# Altium schematic sheet S10_Adc.SchDoc
size 420 x 297 mm; SheetNumber: 10; SheetTotal: 12
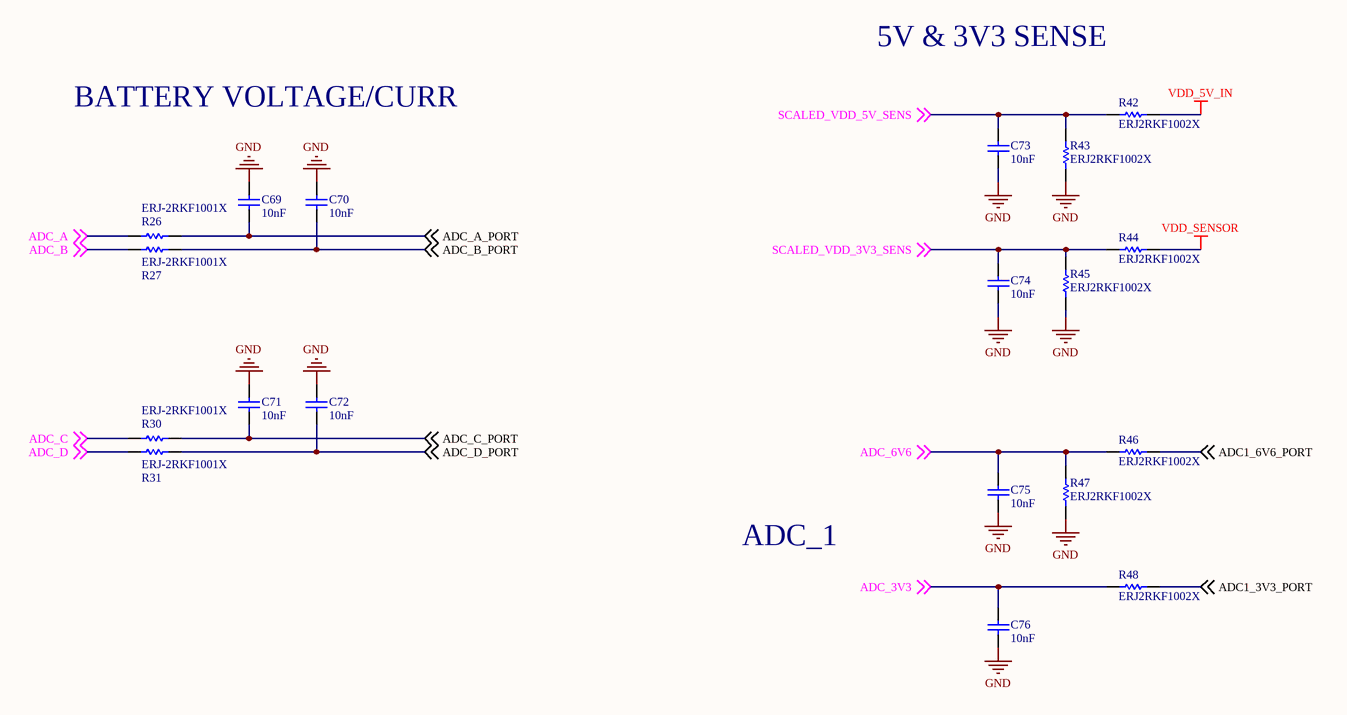
[diagram p0: S10_Adc.SchDoc]

## Parts
C69  10nF  [CAPC1005X55X25LL05T10]
C70  10nF  [CAPC1005X55X25LL05T10]
C71  10nF  [CAPC1005X55X25LL05T10]
C72  10nF  [CAPC1005X55X25LL05T10]
C73  10nF  [CAPC1005X55X25LL05T10]
C74  10nF  [CAPC1005X55X25LL05T10]
C75  10nF  [CAPC1005X55X25LL05T10]
C76  10nF  [CAPC1005X55X25LL05T10]
R26  ERJ-2RKF1001X  [RESC1005X40X25NL05T05]
R27  ERJ-2RKF1001X  [RESC1005X40X25NL05T05]
R30  ERJ-2RKF1001X  [RESC1005X40X25NL05T05]
R31  ERJ-2RKF1001X  [RESC1005X40X25NL05T05]
R42  ERJ2RKF1002X  [RESC1005X40X25LL05T05]
R43  ERJ2RKF1002X  [RESC1005X40X25LL05T05]
R44  ERJ2RKF1002X  [RESC1005X40X25LL05T05]
R45  ERJ2RKF1002X  [RESC1005X40X25LL05T05]
R46  ERJ2RKF1002X  [RESC1005X40X25LL05T05]
R47  ERJ2RKF1002X  [RESC1005X40X25LL05T05]
R48  ERJ2RKF1002X  [RESC1005X40X25LL05T05]

## Nets
GND: C69.2 C70.2 C71.2 C72.2 C73.1 C74.1 C75.1 C76.1 R43.1 R45.1 R47.1
VDD_5V_IN: R42.2
VDD_SENSOR: R44.2
ADC1_3V3_PORT: R48.2 ; off-sheet ADC1_3V3_PORT
ADC1_6V6_PORT: R46.2 ; off-sheet ADC1_6V6_PORT
ADC_3V3: C76.2 R48.1 ; off-sheet ADC_3V3
ADC_6V6: C75.2 R46.1 R47.2 ; off-sheet ADC_6V6
ADC_A: R26.1 ; off-sheet ADC_A
ADC_A_PORT: C69.1 R26.2 ; off-sheet ADC_A_PORT
ADC_B: R27.1 ; off-sheet ADC_B
ADC_B_PORT: C70.1 R27.2 ; off-sheet ADC_B_PORT
ADC_C: R30.1 ; off-sheet ADC_C
ADC_C_PORT: C71.1 R30.2 ; off-sheet ADC_C_PORT
ADC_D: R31.1 ; off-sheet ADC_D
ADC_D_PORT: C72.1 R31.2 ; off-sheet ADC_D_PORT
SCALED_VDD_3V3_SENS: C74.2 R44.1 R45.2 ; off-sheet SCALED_VDD_3V3_SENS
SCALED_VDD_5V_SENS: C73.2 R42.1 R43.2 ; off-sheet SCALED_VDD_5V_SENS

## Notes on the sheet
- 5V & 3V3 SENSE
- BATTERY VOLTAGE/CURR
- ADC_1
- THIS DOCUMENT AND THE DATA DISCLOSED HEREIN OR
- HEREWITH IS THE PROPERTY OF ALTIUM LIMITED AND MAY
- DWG NO:
- REVISION
- REV:
- DESCRIPTION
- DATE
- APPROVED
- BE FREELY DISTRIBUTED IN WHOLE. NO RIGHTS ARE
- RESERVED OR EXPRESS OR IMPLIED WARANTEE GIVEN.
- ENG:
- APPROVALS
- PROJECT
- DSN:
- CHK:
- REFERENCE DOCUMENTS
- PROJECT REVISION:
- TITLE
- DOCUMENT REVISION:
- DESIGN ITEM:
- BOM:
- FAB DWG:
- PCB DWG:
- ASSY DWG:
- SCALE:
- A3
- SIZE
- CAGE CODE
- FILE NAME
- DWG NO.
- SHEET
- OF
- REV

## Library data of the parts
C69-C76 = CMP-1034-01880-2: Manufacturer: Murata; Part Number: GRM155R71E103KA01D
R26 R27 R30 R31 = CMP-1011-00510-4: Chip Resistor, 1 KOhm, +/- 1%, 100 mW, -55 to 155 degC, 0402 (1005 Metric), RoHS, Tape and Reel; Manufacturer: Basic Passives; Voltage Rating: 50 V; Case\/Package: 0402; Resistance: 1 KOhm; Power Rating: 100 mW; PartNumber: ERJ-2RKF1001X; DatasheetVersion: 04/2015; Radiation Hardening: No; Pins: 2; Height: 0.35 mm; RoHSCompliant: true; Case Code (Imperial): 0402; ComponentLink2Description: Datasheet; ComponentLink1Description: Manufacturer URL; PackageReference: 0402; Mount: Surface Mount; Package Quantity: 10000; Tolerance: 1%; ComponentLink1URL: http://www.panasonic.com/; PackageDescription: 2-Pin Surface Mount Device, Body 1 x 0.5 mm; Mounting Technology: Surface Mount; Case Code (Metric): 1005; ComponentLink2URL: http://industrial.panasonic.com/cdbs/www-data/pdf/RDA0000/AOA0000C86.pdf; REACH SVHC: Yes; Packaging: Tape and Reel; Max Operating Temperature: 155 degC; Min Operating Temperature: -55 degC; Width: 0.5 mm; Length: 1 mm
R42-R48 = CMP-2000-07588-1: Chip Resistor, 10 KOhm, +/- 1%, 0.1 W, -55 to 155 degC, 0402 (1005 Metric), RoHS, Tape and Reel; Manufacturer: Panasonic; Power Rating: 100mW; Voltage Rating: 50V; Resistance: 10KOhm; Case\/Package: 0402; Temperature Coefficient: 100ppm\/degreesC; RoHSCompliant: True; Lead Free: LeadFree; Package Quantity: 1; Contact Plating: Tin; Length: 1mm; Radiation Hardening: No; REACH SVHC: NoSVHC; Max Operating Temperature: 155degC; Depth: 0.5mm; Case Code (Imperial): 0402; Military Standard: Not; Package Description: 2-Pin Surface Mount Device, Body 1 x 0.5 mm; Termination: SMD/SMT; Case Code (Metric): 1005; Height: 0.35mm; Packaging: TapeandReel; Voltage Rating (DC): 50V; Package Reference: 402; Number of Pins: 2; Tolerance: 1%; Mounting Technology: SurfaceMount; Width: 0.02inch; Mount: SurfaceMount; Datasheet URL: https://industrial.panasonic.com/cdbs/www-data/pdf/RDA0000/AOA0000C304.pdf; Composition: ThickFilm; Datasheet Version: 02/2017; Manufacturer URL: http://www.panasonic.com/; Max Power Dissipation: 100mW; Number of Terminations: 2; Min Operating Temperature: -55degC